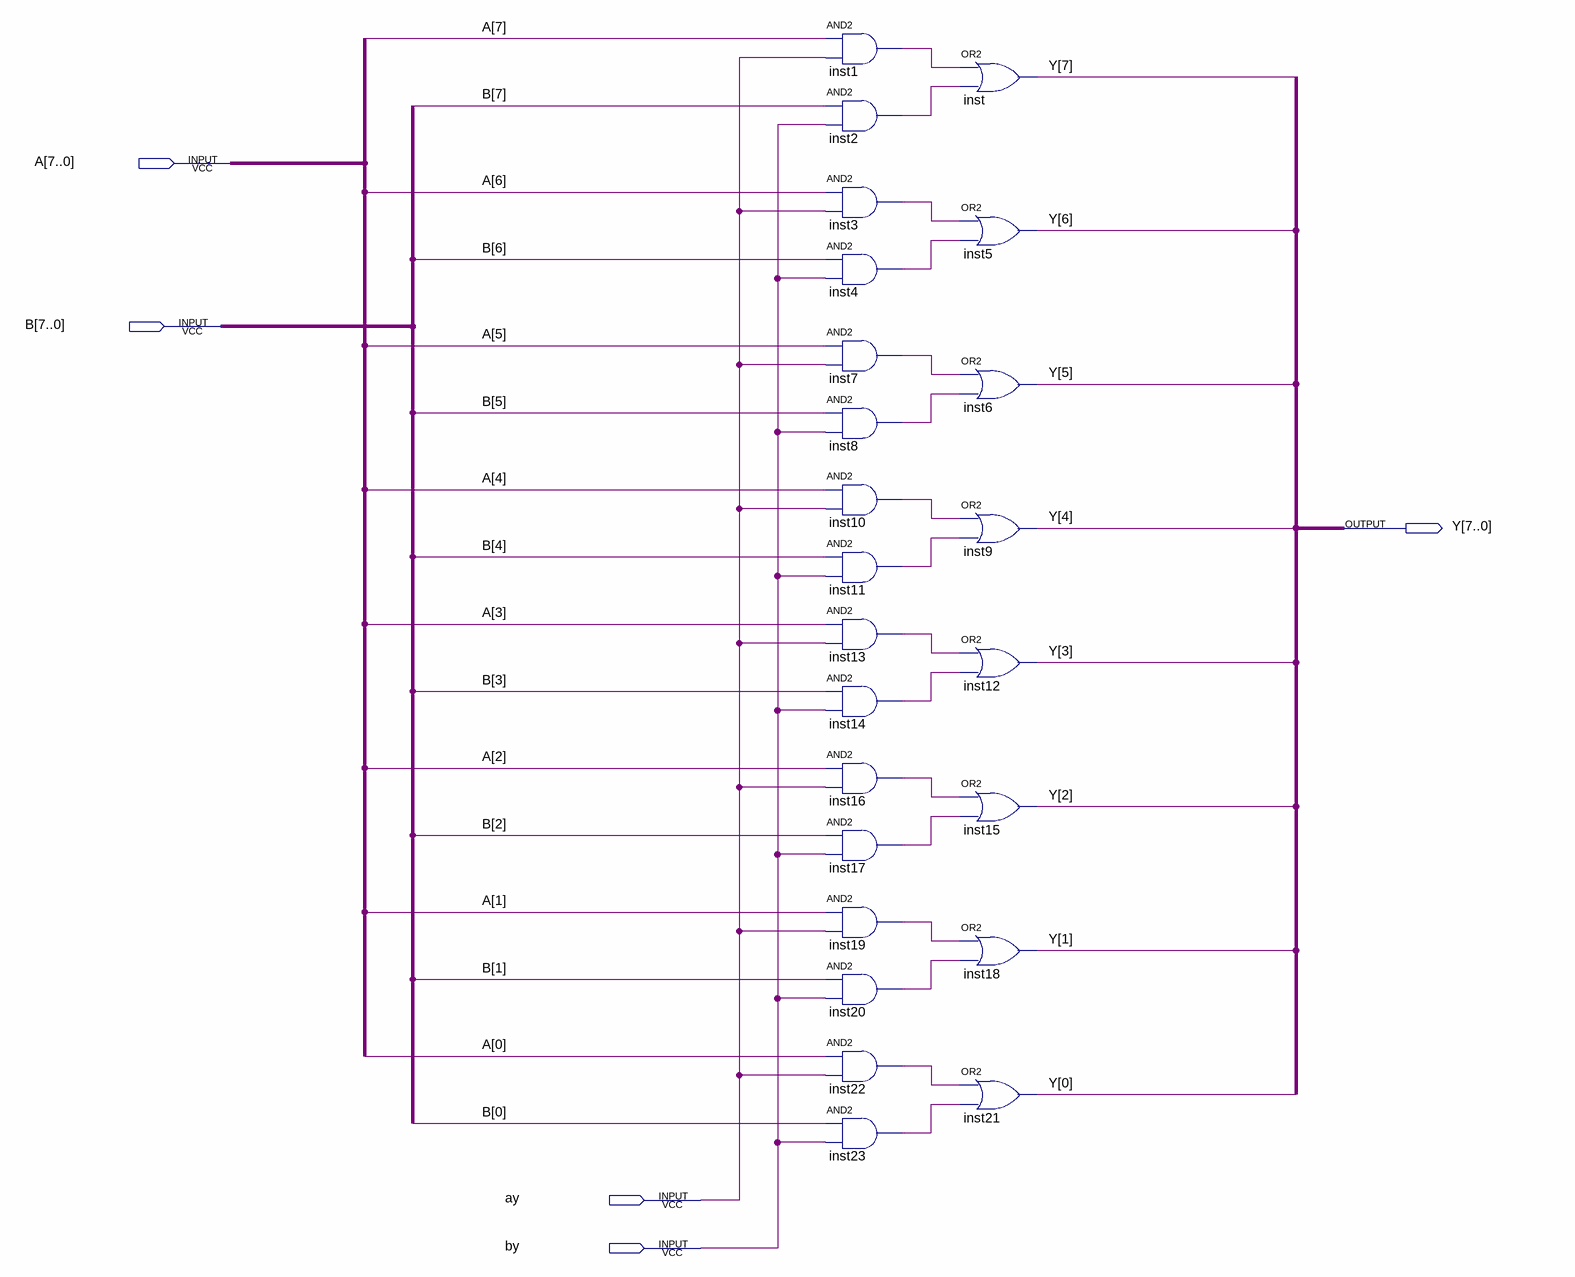
[diagram p0: schematic sheet]
// Quartus schematic sel1bit.bdf as structural Verilog: 24 symbols, 5 pins
module sel1bit (
  input  [7:0] A,
  input  [7:0] B,
  input  ay,
  input  by,
  output [7:0] Y
);

  wire inst1_out, inst2_out, inst3_out, inst4_out, inst7_out, inst8_out, inst10_out, inst11_out, inst13_out,
       inst14_out, inst16_out, inst17_out, inst19_out, inst20_out, inst22_out, inst23_out;

  and inst1 (inst1_out, A[7], ay);
  and inst2 (inst2_out, B[7], by);
  and inst3 (inst3_out, A[6], ay);
  and inst4 (inst4_out, B[6], by);
  and inst7 (inst7_out, A[5], ay);
  and inst8 (inst8_out, B[5], by);
  and inst10 (inst10_out, A[4], ay);
  and inst11 (inst11_out, B[4], by);
  and inst13 (inst13_out, A[3], ay);
  and inst14 (inst14_out, B[3], by);
  and inst16 (inst16_out, A[2], ay);
  and inst17 (inst17_out, B[2], by);
  and inst19 (inst19_out, A[1], ay);
  and inst20 (inst20_out, B[1], by);
  and inst22 (inst22_out, A[0], ay);
  and inst23 (inst23_out, B[0], by);
  or inst (Y[7], inst1_out, inst2_out);
  or inst5 (Y[6], inst3_out, inst4_out);
  or inst6 (Y[5], inst7_out, inst8_out);
  or inst9 (Y[4], inst10_out, inst11_out);
  or inst12 (Y[3], inst13_out, inst14_out);
  or inst15 (Y[2], inst16_out, inst17_out);
  or inst18 (Y[1], inst19_out, inst20_out);
  or inst21 (Y[0], inst22_out, inst23_out);
endmodule
